# Altium project EVLSERVO1_control_v2.PrjPcb (part 4 of 9)
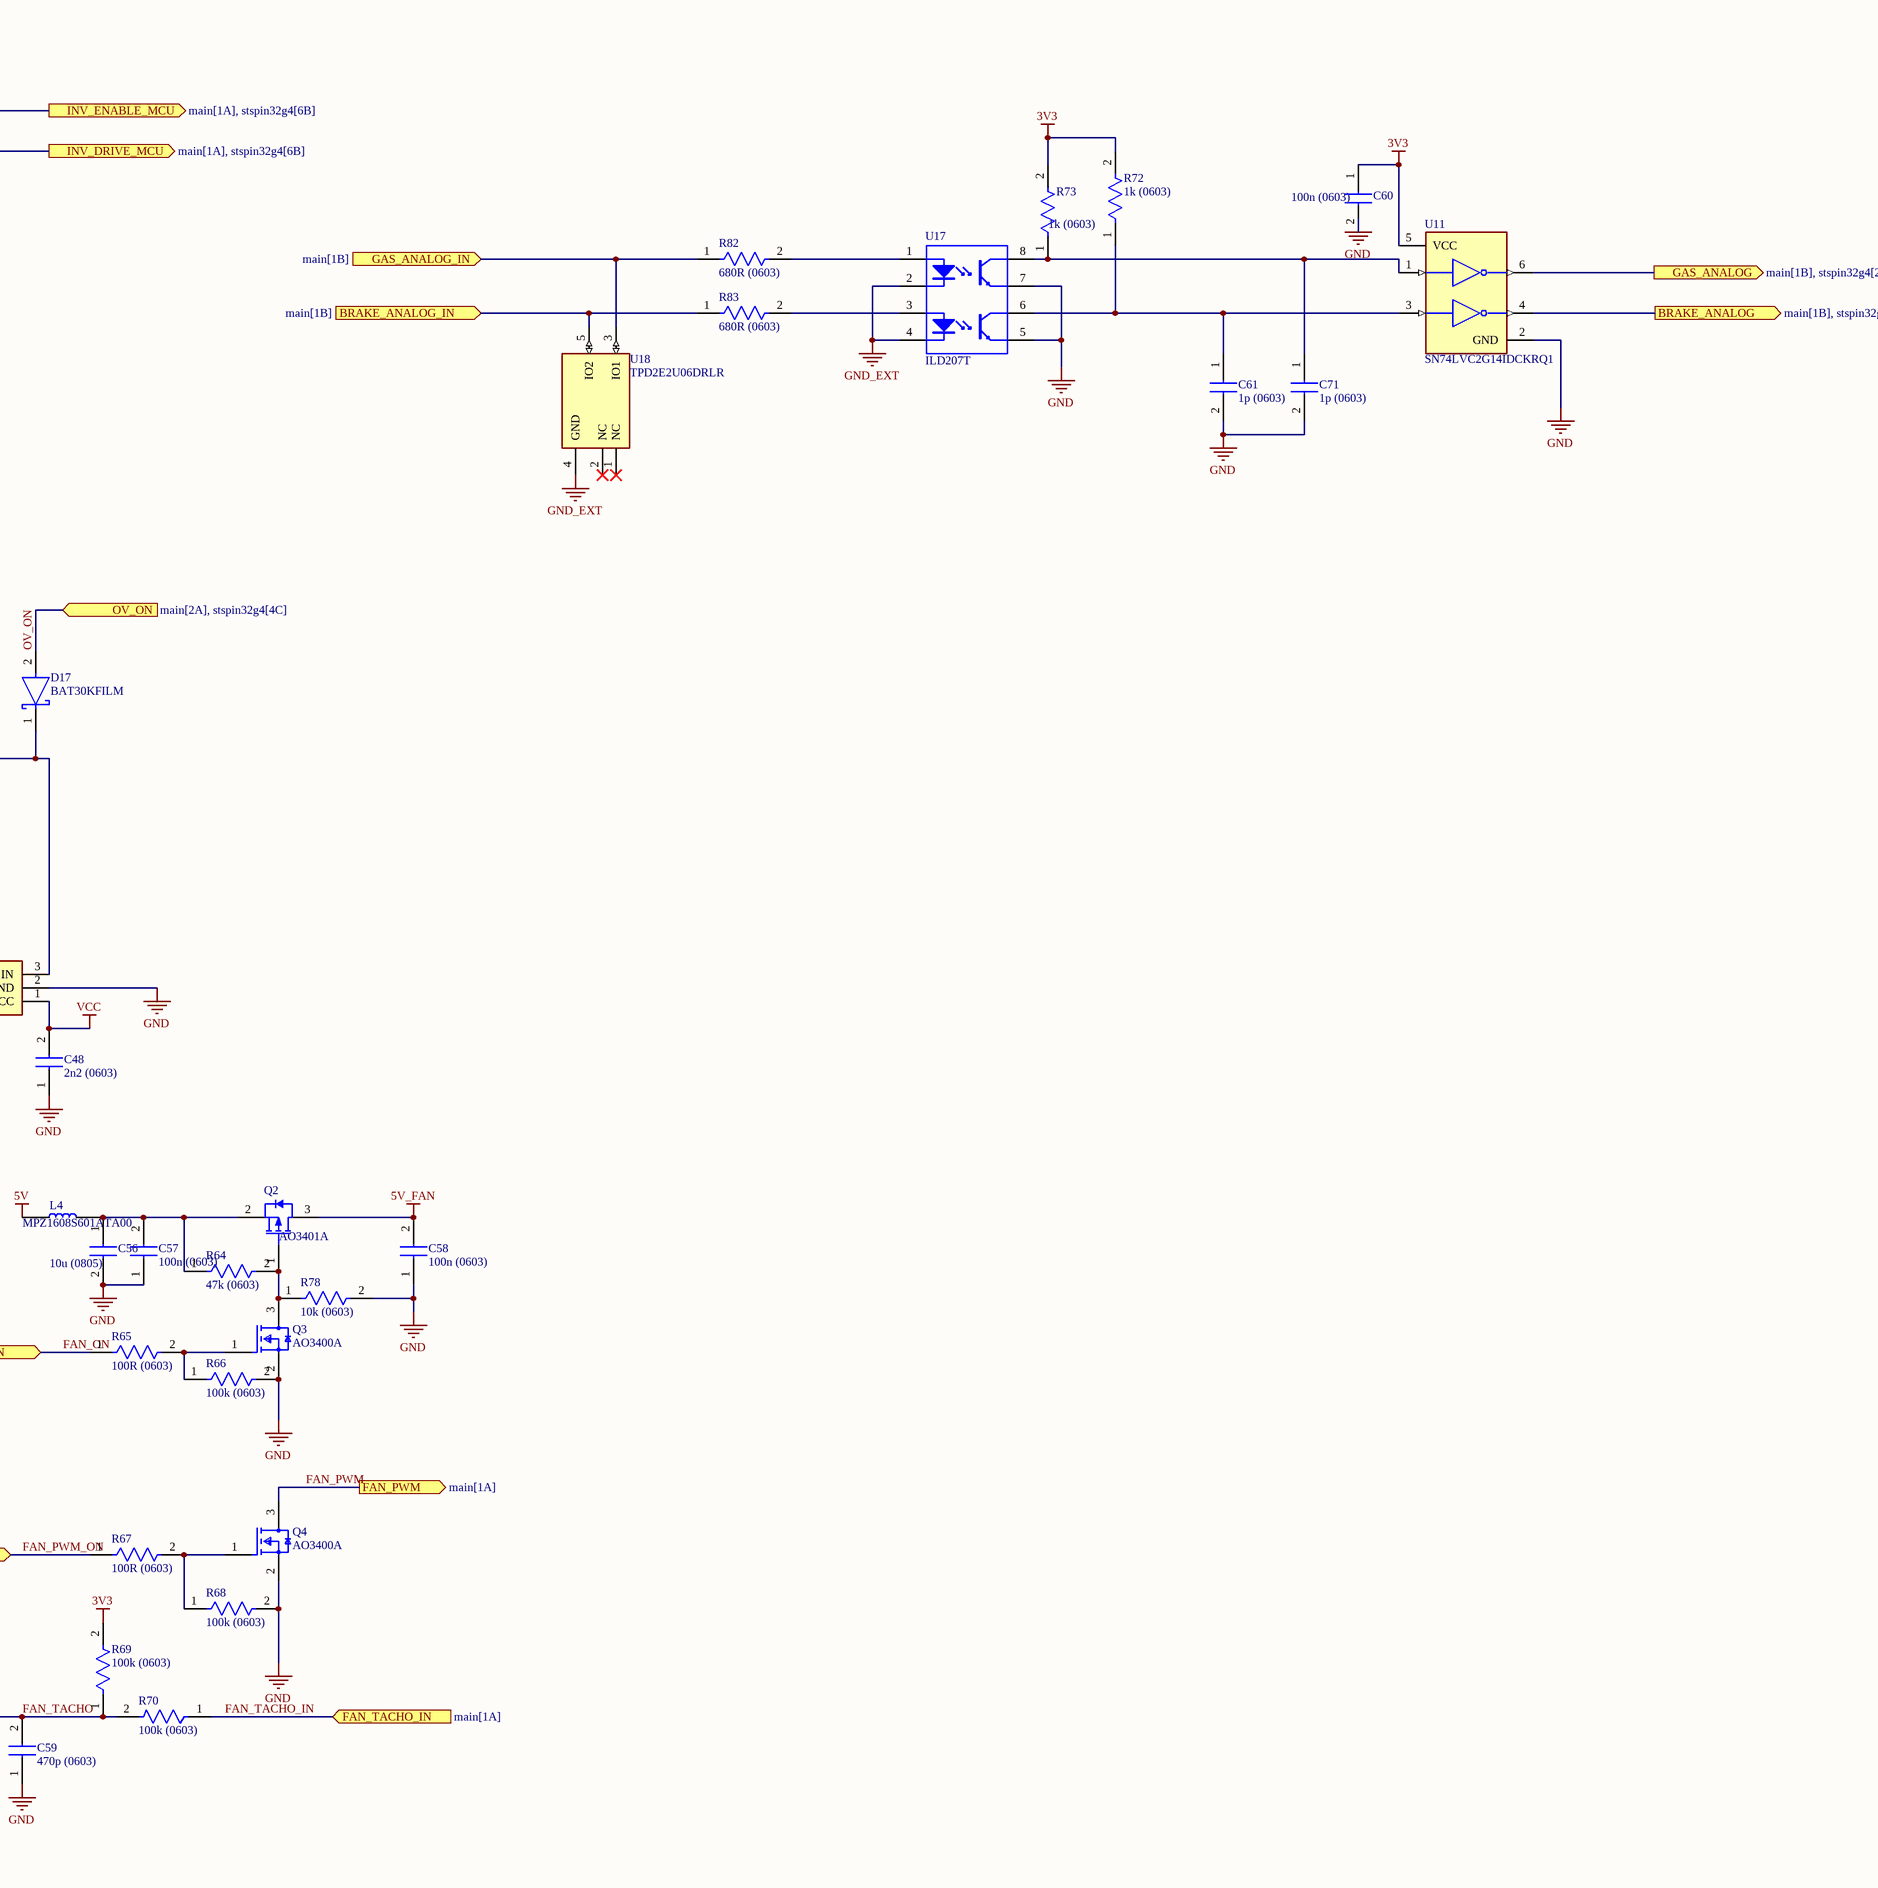
[diagram p7: peripherals.SchDoc, right]

## Sheet peripherals.SchDoc (continued)

### Library data of the parts (continued)
R47-R49 = RK73H1JTTD1000F: Res Thick Film 0603 100 Ohm 1% 0.125W(1/8W) ±100ppm/C Pad SMD Automotive T/R; Manufacturer_Name: Yageo Group; Manufacturer_Part_Number: SR0603FR-7T10KL; Manufacturer Lifecycle Status: ACTIVE; Part Series: High Temperature Chip Resistors; Power Rating: 250mW; Value: 10kΩ; Temperature Coefficient: 100ppm/°C; Voltage Rating: 75V; Working Voltage: 150V; Max Voltage Rating (DC): 100V; Voltage Rating (DC): 50V; Datasheet Link: https://mouser.componentsearchengine.com/Datasheets/1/SR0603FR-7T10KL.pdf; Height: 0.55mm; Mouser Part Number: 603-SR0603FR-7T10KL; Mouser Price/Stock: https://www.mouser.co.uk/ProductDetail/YAGEO/SR0603FR-7T10KL?qs=pfd5qewlna6IurLw3u3uRA%3D%3D; Arrow Part Number: SR0603FR-7T10KL; Arrow Price/Stock: https://www.arrow.com/en/products/sr0603fr-7t10kl/yageo; Supplier: DigiKey; Supplier Part Number: YAG5823CT-ND; Manufacturer: Yageo Group; Manufacturer Part Number: SR0603FR-7T10KL; RoHS: Compliant; Category: Chip SMD Resistors; Pricing: 1=0,67, 10=0,399, 25=0,3376, 50=0,3022, 100=0,2744, 250=0,24612, 500=0,22976, 1000=0,21675 (USD); Case/Package: 0603; China RoHS: Non-Compliant; Composition: Thick Film; Country of Origin: Mainland China, Taiwan; Export Control Classification Number (ECCN) Code: EAR99; Harmonized Tariff Schedule (HTS) Code: 8533.21.00.30; Introduction Date: 2017-10-02; Length: 1.6mm; Lifecycle Status: Production; Max Operating Temperature: 155°C; Min Operating Temperature: -55°C; Mounting Technology: Surface Mount; Number of Terminals: 2; Packaging: Tape & Reel; Ratings: AEC-Q200; REACH SVHC: Yes; Tolerance: 1%; Width: 800µm; ComponentLink1URL: https://datasheet.octopart.com:443/SR0603FR-7T10KL-Yageo-datasheet-176402240.pdf?src-supplier=Farnell; ComponentLink1Description: https://datasheet.octopart.com:443/SR0603FR-7T10KL-Yageo-datasheet-176402240.pdf?src-supplier=Farnell; ComponentLink2URL: https://datasheet.octopart.com:443/SR0603FR-7T10KL-Yageo-datasheet-119732217.pdf?src-supplier=Upverter; ComponentLink2Description: https://datasheet.octopart.com:443/SR0603FR-7T10KL-Yageo-datasheet-119732217.pdf?src-supplier=Upverter; ComponentLink3URL: https://datasheet.octopart.com:443/SR0603FR-7T10KL-Yageo-Group-datasheet-184785656.pdf?src-supplier=Future+Electronics; ComponentLink3Description: https://datasheet.octopart.com:443/SR0603FR-7T10KL-Yageo-Group-datasheet-184785656.pdf?src-supplier=Future+Electronics; ComponentLink4URL: https://datasheet.octopart.com:443/SR0603FR-7T10KL-Yageo-datasheet-155675517.pdf?src-supplier=Future+Electronics; ComponentLink4Description: https://datasheet.octopart.com:443/SR0603FR-7T10KL-Yageo-datasheet-155675517.pdf?src-supplier=Future+Electronics; ComponentLink5URL: https://datasheet.octopart.com:443/SR0603FR-7T10KL-Yageo-datasheet-137701088.pdf?src-supplier=Future+Electronics; ComponentLink5Description: https://datasheet.octopart.com:443/SR0603FR-7T10KL-Yageo-datasheet-137701088.pdf?src-supplier=Future+Electronics; ComponentLink6URL: https://datasheet.octopart.com/SR0603FR-7T10KL-Yageo-datasheet-11047080.pdf; ComponentLink6Description: https://datasheet.octopart.com/SR0603FR-7T10KL-Yageo-datasheet-11047080.pdf; ComponentLink7URL: http://sigma.octopart.com:80/conflict_mineral_statement/Yageo-company-3.pdf?src-supplier=Compliance+Statements; ComponentLink7Description: http://sigma.octopart.com:80/conflict_mineral_statement/Yageo-company-3.pdf?src-supplier=Compliance+Statements; ComponentLink8URL: http://sigma.octopart.com:80/rohs_statement/Yageo-company-2.pdf?src-supplier=Compliance+Statements; ComponentLink8Description: http://sigma.octopart.com:80/rohs_statement/Yageo-company-2.pdf?src-supplier=Compliance+Statements; Stock: 5000; ComponentLink9URL: https://datasheet.octopart.com:443/SR0603FR-7T4R7L-Yageo-datasheet-176402240.pdf?src-supplier=Farnell; ComponentLink9Description: https://datasheet.octopart.com:443/SR0603FR-7T4R7L-Yageo-datasheet-176402240.pdf?src-supplier=Farnell; ComponentLink10URL: https://datasheet.octopart.com:443/SR0603FR-7T4R7L-Yageo-datasheet-119732217.pdf?src-supplier=Upverter; ComponentLink10Description: https://datasheet.octopart.com:443/SR0603FR-7T4R7L-Yageo-datasheet-119732217.pdf?src-supplier=Upverter; ComponentLink11URL: https://datasheet.octopart.com:443/SR0603FR-7T4R7L-Yageo-Group-datasheet-184785656.pdf?src-supplier=Future+Electronics; ComponentLink11Description: https://datasheet.octopart.com:443/SR0603FR-7T4R7L-Yageo-Group-datasheet-184785656.pdf?src-supplier=Future+Electronics; ComponentLink12URL: https://datasheet.octopart.com:443/SR0603FR-7T4R7L-Yageo-datasheet-155675517.pdf?src-supplier=Future+Electronics; ComponentLink12Description: https://datasheet.octopart.com:443/SR0603FR-7T4R7L-Yageo-datasheet-155675517.pdf?src-supplier=Future+Electronics; ComponentLink13URL: https://datasheet.octopart.com:443/SR0603FR-7T4R7L-Yageo-datasheet-137701088.pdf?src-supplier=Future+Electronics; ComponentLink13Description: https://datasheet.octopart.com:443/SR0603FR-7T4R7L-Yageo-datasheet-137701088.pdf?src-supplier=Future+Electronics; ComponentLink14URL: https://datasheet.octopart.com/SR0603FR-7T4R7L-Yageo-datasheet-11047080.pdf; ComponentLink14Description: https://datasheet.octopart.com/SR0603FR-7T4R7L-Yageo-datasheet-11047080.pdf; Schedule B: 8533210045, 8533210045|8533210045|8533210045|8533210045|8533210045; ComponentLink15URL: https://datasheet.octopart.com:443/SR0603FR-7T100KL-Yageo-datasheet-176402240.pdf?src-supplier=element14+APAC; ComponentLink15Description: https://datasheet.octopart.com:443/SR0603FR-7T100KL-Yageo-datasheet-176402240.pdf?src-supplier=element14+APAC; ComponentLink16URL: https://datasheet.octopart.com:443/SR0603FR-7T100KL-Yageo-datasheet-119732217.pdf?src-supplier=Upverter; ComponentLink16Description: https://datasheet.octopart.com:443/SR0603FR-7T100KL-Yageo-datasheet-119732217.pdf?src-supplier=Upverter; ComponentLink17URL: https://datasheet.octopart.com:443/SR0603FR-7T100KL-Yageo-Group-datasheet-184785656.pdf?src-supplier=Future+Electronics; ComponentLink17Description: https://datasheet.octopart.com:443/SR0603FR-7T100KL-Yageo-Group-datasheet-184785656.pdf?src-supplier=Future+Electronics; ComponentLink18URL: https://datasheet.octopart.com:443/SR0603FR-7T100KL-Yageo-datasheet-155675517.pdf?src-supplier=Future+Electronics; ComponentLink18Description: https://datasheet.octopart.com:443/SR0603FR-7T100KL-Yageo-datasheet-155675517.pdf?src-supplier=Future+Electronics; ComponentLink19URL: https://datasheet.octopart.com:443/SR0603FR-7T100KL-Yageo-datasheet-137701088.pdf?src-supplier=Future+Electronics; ComponentLink19Description: https://datasheet.octopart.com:443/SR0603FR-7T100KL-Yageo-datasheet-137701088.pdf?src-supplier=Future+Electronics; ComponentLink20URL: https://datasheet.octopart.com/SR0603FR-7T100KL-Yageo-datasheet-11047080.pdf; ComponentLink20Description: https://datasheet.octopart.com/SR0603FR-7T100KL-Yageo-datasheet-11047080.pdf; ComponentLink21URL: https://datasheet.octopart.com:443/RS73F1JTTD2001B-KOA-Speer-datasheet-182143723.pdf?src-supplier=IHS; ComponentLink21Description: https://datasheet.octopart.com:443/RS73F1JTTD2001B-KOA-Speer-datasheet-182143723.pdf?src-supplier=IHS; ComponentLink22URL: https://datasheet.octopart.com:443/RS73F1JTTD2001B-KOA-Speer-datasheet-141350738.pdf?src-supplier=KOA+Speer+SCT; ComponentLink22Description: https://datasheet.octopart.com:443/RS73F1JTTD2001B-KOA-Speer-datasheet-141350738.pdf?src-supplier=KOA+Speer+SCT; ComponentLink23URL: https://sigma.octopart.com:443/141350679/technical_drawing/KOA-Speer-RS73F1JTTD2001B.pdf?src-supplier=KOA+Speer+SCT; ComponentLink23Description: https://sigma.octopart.com:443/141350679/technical_drawing/KOA-Speer-RS73F1JTTD2001B.pdf?src-supplier=KOA+Speer+SCT; ComponentLink24URL: http://sigma.octopart.com:80/rohs_statement/KOA-Speer-company-17.pdf?src-supplier=Compliance+Statements; ComponentLink24Description: http://sigma.octopart.com:80/rohs_statement/KOA-Speer-company-17.pdf?src-supplier=Compliance+Statements; ComponentLink25URL: https://datasheet.octopart.com:443/ERJH3EF2201V-Panasonic-datasheet-182147299.pdf?src-supplier=IHS; ComponentLink25Description: https://datasheet.octopart.com:443/ERJH3EF2201V-Panasonic-datasheet-182147299.pdf?src-supplier=IHS; ComponentLink26URL: https://datasheet.octopart.com:443/ERJH3EF2201V-Panasonic-datasheet-150823776.pdf?src-supplier=Panasonic; ComponentLink26Description: https://datasheet.octopart.com:443/ERJH3EF2201V-Panasonic-datasheet-150823776.pdf?src-supplier=Panasonic; ComponentLink27URL: https://datasheet.octopart.com:443/ERJH3EF2201V-Panasonic-datasheet-165581513.pdf?src-supplier=TME; ComponentLink27Description: https://datasheet.octopart.com:443/ERJH3EF2201V-Panasonic-datasheet-165581513.pdf?src-supplier=TME; Case Code (Imperial): 0603; Case Code (Metric): 1608; Depth: 800µm; Lead Free: Lead Free; Military Standard: Not; Pins: 2; Termination: SMD/SMT; ComponentLink28URL: https://datasheet.octopart.com:443/RK73H1JTTD1000F-KOA-Speer-datasheet-181956035.pdf?src-supplier=IHS; ComponentLink28Description: https://datasheet.octopart.com:443/RK73H1JTTD1000F-KOA-Speer-datasheet-181956035.pdf?src-supplier=IHS; ComponentLink29URL: https://datasheet.octopart.com/RK73H1JTTD1000F-KOA-Speer-datasheet-11590619.pdf; ComponentLink29Description: https://datasheet.octopart.com/RK73H1JTTD1000F-KOA-Speer-datasheet-11590619.pdf; ComponentLink30URL: https://sigma.octopart.com:443/138820520/technical_drawing/KOA-Speer-RK73H1JTTD1000F.pdf?src-supplier=Upverter; ComponentLink30Description: https://sigma.octopart.com:443/138820520/technical_drawing/KOA-Speer-RK73H1JTTD1000F.pdf?src-supplier=Upverter; ComponentLink31URL: https://datasheet.octopart.com:443/RK73H1JTTD1000F-KOA-Speer-datasheet-141253609.pdf?src-supplier=Upverter; ComponentLink31Description: https://datasheet.octopart.com:443/RK73H1JTTD1000F-KOA-Speer-datasheet-141253609.pdf?src-supplier=Upverter; ComponentLink32URL: https://datasheet.octopart.com:443/RK73H1JTTD1000F-KOA-Speer-datasheet-141913736.pdf?src-supplier=Upverter; ComponentLink32Description: https://datasheet.octopart.com:443/RK73H1JTTD1000F-KOA-Speer-datasheet-141913736.pdf?src-supplier=Upverter; ComponentLink33URL: https://datasheet.octopart.com:443/RK73H1JTTD1000F-KOA-Speer-datasheet-149653815.pdf?src-supplier=Farnell; ComponentLink33Description: https://datasheet.octopart.com:443/RK73H1JTTD1000F-KOA-Speer-datasheet-149653815.pdf?src-supplier=Farnell; ComponentLink34URL: https://datasheet.octopart.com:443/RK73H1JTTD1000F-KOA-Speer-datasheet-188906116.pdf?src-supplier=TME; ComponentLink34Description: https://datasheet.octopart.com:443/RK73H1JTTD1000F-KOA-Speer-datasheet-188906116.pdf?src-supplier=TME; ComponentLink35URL: https://datasheet.octopart.com:443/RK73H1JTTD1000F-KOA-Speer-datasheet-155997623.pdf?src-supplier=Future+Electronics; ComponentLink35Description: https://datasheet.octopart.com:443/RK73H1JTTD1000F-KOA-Speer-datasheet-155997623.pdf?src-supplier=Future+Electronics; ComponentLink36URL: https://datasheet.octopart.com:443/RK73H1JTTD1000F-KOA-Speer-datasheet-11541643.pdf?src-supplier=Arrow+Electronics; ComponentLink36Description: https://datasheet.octopart.com:443/RK73H1JTTD1000F-KOA-Speer-datasheet-11541643.pdf?src-supplier=Arrow+Electronics; ComponentLink37URL: https://datasheet.octopart.com:443/RK73H1JTTD1000F-KOA-Speer-datasheet-10854116.pdf?src-supplier=element14+APAC; ComponentLink37Description: https://datasheet.octopart.com:443/RK73H1JTTD1000F-KOA-Speer-datasheet-10854116.pdf?src-supplier=element14+APAC; ComponentLink38URL: https://datasheet.octopart.com:443/RK73H1JTTD1000F-KOA-Speer-datasheet-5377369.pdf?src-supplier=Garrett; ComponentLink38Description: https://datasheet.octopart.com:443/RK73H1JTTD1000F-KOA-Speer-datasheet-5377369.pdf?src-supplier=Garrett; ComponentLink39URL: https://datasheet.octopart.com:443/RK73H1JTTD1000F-KOA-Speer-datasheet-5377256.pdf?src-supplier=Garrett; ComponentLink39Description: https://datasheet.octopart.com:443/RK73H1JTTD1000F-KOA-Speer-datasheet-5377256.pdf?src-supplier=Garrett; ComponentLink40URL: https://datasheet.octopart.com:443/RK73H1JTTD1000F-KOA-Speer-datasheet-109233.pdf?src-supplier=Garrett; ComponentLink40Description: https://datasheet.octopart.com:443/RK73H1JTTD1000F-KOA-Speer-datasheet-109233.pdf?src-supplier=Garrett
R72-R75 = ERJ-H3EF1802V: Fixed Resistor, Metal Glaze/thick Film, 0.125W, 18000ohm, 75V, 1% +/-Tol, 100ppm/Cel, Surface Mount, 0603; Manufacturer_Name: Yageo Group; Manufacturer_Part_Number: SR0603FR-7T10KL; Manufacturer Lifecycle Status: ACTIVE; Part Series: High Temperature Chip Resistors; Power Rating: 250mW; Value: 10kΩ; Temperature Coefficient: 100ppm/°C; Working Voltage: 150V; Voltage Rating (DC): 50V; Max Power Dissipation: 125mW; Datasheet Link: https://mouser.componentsearchengine.com/Datasheets/1/SR0603FR-7T10KL.pdf; Height: 0.55mm; Mouser Part Number: 603-SR0603FR-7T10KL; Mouser Price/Stock: https://www.mouser.co.uk/ProductDetail/YAGEO/SR0603FR-7T10KL?qs=pfd5qewlna6IurLw3u3uRA%3D%3D; Arrow Part Number: SR0603FR-7T10KL; Arrow Price/Stock: https://www.arrow.com/en/products/sr0603fr-7t10kl/yageo; Supplier: DigiKey; Supplier Part Number: YAG5823CT-ND; Manufacturer: Yageo Group; Manufacturer Part Number: SR0603FR-7T10KL; RoHS: Compliant; Category: Chip SMD Resistors; Pricing: 1=0,67, 10=0,399, 25=0,3376, 50=0,3022, 100=0,2744, 250=0,24612, 500=0,22976, 1000=0,21675 (USD); Case/Package: 0603; China RoHS: Non-Compliant; Composition: Thick Film; Country of Origin: Mainland China, Taiwan; Export Control Classification Number (ECCN) Code: EAR99; Harmonized Tariff Schedule (HTS) Code: 8533.21.00.30; Introduction Date: 2017-10-02; Length: 1.6mm; Lifecycle Status: Production; Max Operating Temperature: 155°C; Min Operating Temperature: -55°C; Mounting Technology: Surface Mount; Number of Terminals: 2; Packaging: Tape & Reel; Ratings: AEC-Q200; REACH SVHC: Yes; Tolerance: 1%; Voltage Rating: 75V; Width: 800µm; ComponentLink1URL: https://datasheet.octopart.com:443/SR0603FR-7T10KL-Yageo-datasheet-176402240.pdf?src-supplier=Farnell; ComponentLink1Description: https://datasheet.octopart.com:443/SR0603FR-7T10KL-Yageo-datasheet-176402240.pdf?src-supplier=Farnell; ComponentLink2URL: https://datasheet.octopart.com:443/SR0603FR-7T10KL-Yageo-datasheet-119732217.pdf?src-supplier=Upverter; ComponentLink2Description: https://datasheet.octopart.com:443/SR0603FR-7T10KL-Yageo-datasheet-119732217.pdf?src-supplier=Upverter; ComponentLink3URL: https://datasheet.octopart.com:443/SR0603FR-7T10KL-Yageo-Group-datasheet-184785656.pdf?src-supplier=Future+Electronics; ComponentLink3Description: https://datasheet.octopart.com:443/SR0603FR-7T10KL-Yageo-Group-datasheet-184785656.pdf?src-supplier=Future+Electronics; ComponentLink4URL: https://datasheet.octopart.com:443/SR0603FR-7T10KL-Yageo-datasheet-155675517.pdf?src-supplier=Future+Electronics; ComponentLink4Description: https://datasheet.octopart.com:443/SR0603FR-7T10KL-Yageo-datasheet-155675517.pdf?src-supplier=Future+Electronics; ComponentLink5URL: https://datasheet.octopart.com:443/SR0603FR-7T10KL-Yageo-datasheet-137701088.pdf?src-supplier=Future+Electronics; ComponentLink5Description: https://datasheet.octopart.com:443/SR0603FR-7T10KL-Yageo-datasheet-137701088.pdf?src-supplier=Future+Electronics; ComponentLink6URL: https://datasheet.octopart.com/SR0603FR-7T10KL-Yageo-datasheet-11047080.pdf; ComponentLink6Description: https://datasheet.octopart.com/SR0603FR-7T10KL-Yageo-datasheet-11047080.pdf; ComponentLink7URL: http://sigma.octopart.com:80/conflict_mineral_statement/Yageo-company-3.pdf?src-supplier=Compliance+Statements; ComponentLink7Description: http://sigma.octopart.com:80/conflict_mineral_statement/Yageo-company-3.pdf?src-supplier=Compliance+Statements; ComponentLink8URL: http://sigma.octopart.com:80/rohs_statement/Yageo-company-2.pdf?src-supplier=Compliance+Statements; ComponentLink8Description: http://sigma.octopart.com:80/rohs_statement/Yageo-company-2.pdf?src-supplier=Compliance+Statements; Stock: 5000; ComponentLink9URL: https://datasheet.octopart.com:443/SR0603FR-7T4R7L-Yageo-datasheet-176402240.pdf?src-supplier=Farnell; ComponentLink9Description: https://datasheet.octopart.com:443/SR0603FR-7T4R7L-Yageo-datasheet-176402240.pdf?src-supplier=Farnell; ComponentLink10URL: https://datasheet.octopart.com:443/SR0603FR-7T4R7L-Yageo-datasheet-119732217.pdf?src-supplier=Upverter; ComponentLink10Description: https://datasheet.octopart.com:443/SR0603FR-7T4R7L-Yageo-datasheet-119732217.pdf?src-supplier=Upverter; ComponentLink11URL: https://datasheet.octopart.com:443/SR0603FR-7T4R7L-Yageo-Group-datasheet-184785656.pdf?src-supplier=Future+Electronics; ComponentLink11Description: https://datasheet.octopart.com:443/SR0603FR-7T4R7L-Yageo-Group-datasheet-184785656.pdf?src-supplier=Future+Electronics; ComponentLink12URL: https://datasheet.octopart.com:443/SR0603FR-7T4R7L-Yageo-datasheet-155675517.pdf?src-supplier=Future+Electronics; ComponentLink12Description: https://datasheet.octopart.com:443/SR0603FR-7T4R7L-Yageo-datasheet-155675517.pdf?src-supplier=Future+Electronics; ComponentLink13URL: https://datasheet.octopart.com:443/SR0603FR-7T4R7L-Yageo-datasheet-137701088.pdf?src-supplier=Future+Electronics; ComponentLink13Description: https://datasheet.octopart.com:443/SR0603FR-7T4R7L-Yageo-datasheet-137701088.pdf?src-supplier=Future+Electronics; ComponentLink14URL: https://datasheet.octopart.com/SR0603FR-7T4R7L-Yageo-datasheet-11047080.pdf; ComponentLink14Description: https://datasheet.octopart.com/SR0603FR-7T4R7L-Yageo-datasheet-11047080.pdf; Max Voltage Rating (DC): 150V; ComponentLink15URL: https://datasheet.octopart.com:443/SG73G1JTTD5102C-KOA-Speer-datasheet-181956059.pdf?src-supplier=IHS; ComponentLink15Description: https://datasheet.octopart.com:443/SG73G1JTTD5102C-KOA-Speer-datasheet-181956059.pdf?src-supplier=IHS; ComponentLink16URL: https://sigma.octopart.com:443/141350679/technical_drawing/KOA-Speer-SG73G1JTTD5102C.pdf?src-supplier=KOA+Speer+SCT; ComponentLink16Description: https://sigma.octopart.com:443/141350679/technical_drawing/KOA-Speer-SG73G1JTTD5102C.pdf?src-supplier=KOA+Speer+SCT; ComponentLink17URL: https://datasheet.octopart.com:443/SG73G1JTTD5102C-KOA-Speer-datasheet-141350755.pdf?src-supplier=KOA+Speer+SCT; ComponentLink17Description: https://datasheet.octopart.com:443/SG73G1JTTD5102C-KOA-Speer-datasheet-141350755.pdf?src-supplier=KOA+Speer+SCT; ComponentLink18URL: http://sigma.octopart.com:80/rohs_statement/KOA-Speer-company-17.pdf?src-supplier=Compliance+Statements; ComponentLink18Description: http://sigma.octopart.com:80/rohs_statement/KOA-Speer-company-17.pdf?src-supplier=Compliance+Statements; ComponentLink19URL: https://datasheet.octopart.com:443/ESR03EZPD5102-ROHM-datasheet-182147624.pdf?src-supplier=IHS; ComponentLink19Description: https://datasheet.octopart.com:443/ESR03EZPD5102-ROHM-datasheet-182147624.pdf?src-supplier=IHS; Case Code (Imperial): 0603; Case Code (Metric): 1608; Depth: 800µm; Lead Free: Lead Free; Military Standard: Not; Schedule B: 8533210045, 8533210045|8533210045, 8533210045|8533210045|8533210045, 8533210045|8533210045|8533210045|8533210045; Termination: SMD/SMT; ComponentLink20URL: https://datasheet.octopart.com:443/RK73H1JTTD68R0F-KOA-Speer-datasheet-181956035.pdf?src-supplier=IHS; ComponentLink20Description: https://datasheet.octopart.com:443/RK73H1JTTD68R0F-KOA-Speer-datasheet-181956035.pdf?src-supplier=IHS; ComponentLink21URL: https://datasheet.octopart.com:443/RK73H1JTTD68R0F-KOA-Speer-datasheet-11590619.pdf?src-supplier=Upverter; ComponentLink21Description: https://datasheet.octopart.com:443/RK73H1JTTD68R0F-KOA-Speer-datasheet-11590619.pdf?src-supplier=Upverter; ComponentLink22URL: https://datasheet.octopart.com:443/RK73H1JTTD68R0F-KOA-Speer-datasheet-149653815.pdf?src-supplier=Newark; ComponentLink22Description: https://datasheet.octopart.com:443/RK73H1JTTD68R0F-KOA-Speer-datasheet-149653815.pdf?src-supplier=Newark; ComponentLink23URL: https://datasheet.octopart.com:443/RK73H1JTTD68R0F-KOA-Speer-datasheet-10854116.pdf?src-supplier=element14+APAC; ComponentLink23Description: https://datasheet.octopart.com:443/RK73H1JTTD68R0F-KOA-Speer-datasheet-10854116.pdf?src-supplier=element14+APAC; Contact Plating: Tin; Features: Anti-Sulfur, Moisture Resistant; Number of Terminations: 2; Radiation Hardening: No; ComponentLink24URL: https://datasheet.octopart.com:443/RNCP0603FTD10K0-Stackpole-Electronics-datasheet-182148179.pdf?src-supplier=IHS; ComponentLink24Description: https://datasheet.octopart.com:443/RNCP0603FTD10K0-Stackpole-Electronics-datasheet-182148179.pdf?src-supplier=IHS; ComponentLink25URL: https://datasheet.octopart.com:443/RNCP0603FTD10K0-Stackpole-Electronics-datasheet-141193801.pdf?src-supplier=Upverter; ComponentLink25Description: https://datasheet.octopart.com:443/RNCP0603FTD10K0-Stackpole-Electronics-datasheet-141193801.pdf?src-supplier=Upverter; ComponentLink26URL: https://datasheet.octopart.com:443/RNCP0603FTD10K0-Stackpole-Electronics-datasheet-38896780.pdf?src-supplier=Upverter; ComponentLink26Description: https://datasheet.octopart.com:443/RNCP0603FTD10K0-Stackpole-Electronics-datasheet-38896780.pdf?src-supplier=Upverter; ComponentLink27URL: https://datasheet.octopart.com:443/RNCP0603FTD10K0-Stackpole-Electronics-datasheet-149178200.pdf?src-supplier=Upverter; ComponentLink27Description: https://datasheet.octopart.com:443/RNCP0603FTD10K0-Stackpole-Electronics-datasheet-149178200.pdf?src-supplier=Upverter; ComponentLink28URL: https://datasheet.octopart.com:443/RNCP0603FTD10K0-Stackpole-Electronics-datasheet-33021030.pdf?src-supplier=Future+Electronics; ComponentLink28Description: https://datasheet.octopart.com:443/RNCP0603FTD10K0-Stackpole-Electronics-datasheet-33021030.pdf?src-supplier=Future+Electronics; ComponentLink29URL: http://sigma.octopart.com:80/15942470/materials_sheet/Stackpole-Electronics-RNCP0603FTD10K0.pdf?src-supplier=Compliance+Statements; ComponentLink29Description: http://sigma.octopart.com:80/15942470/materials_sheet/Stackpole-Electronics-RNCP0603FTD10K0.pdf?src-supplier=Compliance+Statements; ComponentLink30URL: http://sigma.octopart.com:80/141158212/rohs_statement/Stackpole-Electronics-RNCP0603FTD10K0.pdf?src-supplier=Compliance+Statements; ComponentLink30Description: http://sigma.octopart.com:80/141158212/rohs_statement/Stackpole-Electronics-RNCP0603FTD10K0.pdf?src-supplier=Compliance+Statements; ComponentLink31URL: http://sigma.octopart.com:80/141158211/reach_statement/Stackpole-Electronics-RNCP0603FTD10K0.pdf?src-supplier=Compliance+Statements; ComponentLink31Description: http://sigma.octopart.com:80/141158211/reach_statement/Stackpole-Electronics-RNCP0603FTD10K0.pdf?src-supplier=Compliance+Statements; ComponentLink32URL: https://datasheet.octopart.com:443/ERJH3EF1802V-Panasonic-datasheet-182147299.pdf?src-supplier=IHS; ComponentLink32Description: https://datasheet.octopart.com:443/ERJH3EF1802V-Panasonic-datasheet-182147299.pdf?src-supplier=IHS; ComponentLink33URL: https://datasheet.octopart.com:443/ERJH3EF1802V-Panasonic-datasheet-150823776.pdf?src-supplier=Panasonic; ComponentLink33Description: https://datasheet.octopart.com:443/ERJH3EF1802V-Panasonic-datasheet-150823776.pdf?src-supplier=Panasonic; ComponentLink34URL: https://datasheet.octopart.com:443/ERJH3EF1802V-Panasonic-datasheet-165581513.pdf?src-supplier=TME; ComponentLink34Description: https://datasheet.octopart.com:443/ERJH3EF1802V-Panasonic-datasheet-165581513.pdf?src-supplier=TME
R76 R77 R82 R83 = RK73H1JTTD1001F: Resistor Thick Film 0603 1K Ohm 1% 1/10W ±100ppm/°C SMD Punched Paper Tape and Reel; Manufacturer_Name: Yageo Group; Manufacturer_Part_Number: SR0603FR-7T10KL; Power Rating: 250mW; Value: 10kΩ; Voltage Rating: 75V; Working Voltage: 150V; Voltage Rating (DC): 50V; Datasheet Link: https://mouser.componentsearchengine.com/Datasheets/1/SR0603FR-7T10KL.pdf; Height: 0.55mm; Mouser Part Number: 603-SR0603FR-7T10KL; Mouser Price/Stock: https://www.mouser.co.uk/ProductDetail/YAGEO/SR0603FR-7T10KL?qs=pfd5qewlna6IurLw3u3uRA%3D%3D; Arrow Part Number: SR0603FR-7T10KL; Arrow Price/Stock: https://www.arrow.com/en/products/sr0603fr-7t10kl/yageo; Supplier: DigiKey; Supplier Part Number: YAG5823CT-ND; Manufacturer: Yageo Group; Manufacturer Part Number: SR0603FR-7T10KL; RoHS: Compliant; Category: Chip SMD Resistors; Pricing: 1=0,67, 10=0,399, 25=0,3376, 50=0,3022, 100=0,2744, 250=0,24612, 500=0,22976, 1000=0,21675 (USD); Case/Package: 0603; China RoHS: Non-Compliant; Composition: Thick Film; Country of Origin: Mainland China, Taiwan; Export Control Classification Number (ECCN) Code: EAR99; Harmonized Tariff Schedule (HTS) Code: 8533.21.00.30; Introduction Date: 2017-10-02; Length: 1.6mm; Lifecycle Status: Production; Max Operating Temperature: 155°C; Min Operating Temperature: -55°C; Mounting Technology: Surface Mount; Number of Terminals: 2; Packaging: Tape & Reel; Ratings: AEC-Q200; REACH SVHC: Yes; Temperature Coefficient: 100ppm/°C; Tolerance: 1%; Width: 800µm; ComponentLink1URL: https://datasheet.octopart.com:443/SR0603FR-7T10KL-Yageo-datasheet-176402240.pdf?src-supplier=Farnell; ComponentLink1Description: https://datasheet.octopart.com:443/SR0603FR-7T10KL-Yageo-datasheet-176402240.pdf?src-supplier=Farnell; ComponentLink2URL: https://datasheet.octopart.com:443/SR0603FR-7T10KL-Yageo-datasheet-119732217.pdf?src-supplier=Upverter; ComponentLink2Description: https://datasheet.octopart.com:443/SR0603FR-7T10KL-Yageo-datasheet-119732217.pdf?src-supplier=Upverter; ComponentLink3URL: https://datasheet.octopart.com:443/SR0603FR-7T10KL-Yageo-Group-datasheet-184785656.pdf?src-supplier=Future+Electronics; ComponentLink3Description: https://datasheet.octopart.com:443/SR0603FR-7T10KL-Yageo-Group-datasheet-184785656.pdf?src-supplier=Future+Electronics; ComponentLink4URL: https://datasheet.octopart.com:443/SR0603FR-7T10KL-Yageo-datasheet-155675517.pdf?src-supplier=Future+Electronics; ComponentLink4Description: https://datasheet.octopart.com:443/SR0603FR-7T10KL-Yageo-datasheet-155675517.pdf?src-supplier=Future+Electronics; ComponentLink5URL: https://datasheet.octopart.com:443/SR0603FR-7T10KL-Yageo-datasheet-137701088.pdf?src-supplier=Future+Electronics; ComponentLink5Description: https://datasheet.octopart.com:443/SR0603FR-7T10KL-Yageo-datasheet-137701088.pdf?src-supplier=Future+Electronics; ComponentLink6URL: https://datasheet.octopart.com/SR0603FR-7T10KL-Yageo-datasheet-11047080.pdf; ComponentLink6Description: https://datasheet.octopart.com/SR0603FR-7T10KL-Yageo-datasheet-11047080.pdf; ComponentLink7URL: http://sigma.octopart.com:80/conflict_mineral_statement/Yageo-company-3.pdf?src-supplier=Compliance+Statements; ComponentLink7Description: http://sigma.octopart.com:80/conflict_mineral_statement/Yageo-company-3.pdf?src-supplier=Compliance+Statements; ComponentLink8URL: http://sigma.octopart.com:80/rohs_statement/Yageo-company-2.pdf?src-supplier=Compliance+Statements; ComponentLink8Description: http://sigma.octopart.com:80/rohs_statement/Yageo-company-2.pdf?src-supplier=Compliance+Statements; Stock: 5000; ComponentLink9URL: https://datasheet.octopart.com:443/SR0603FR-7T4R7L-Yageo-datasheet-176402240.pdf?src-supplier=Farnell; ComponentLink9Description: https://datasheet.octopart.com:443/SR0603FR-7T4R7L-Yageo-datasheet-176402240.pdf?src-supplier=Farnell; ComponentLink10URL: https://datasheet.octopart.com:443/SR0603FR-7T4R7L-Yageo-datasheet-119732217.pdf?src-supplier=Upverter; ComponentLink10Description: https://datasheet.octopart.com:443/SR0603FR-7T4R7L-Yageo-datasheet-119732217.pdf?src-supplier=Upverter; ComponentLink11URL: https://datasheet.octopart.com:443/SR0603FR-7T4R7L-Yageo-Group-datasheet-184785656.pdf?src-supplier=Future+Electronics; ComponentLink11Description: https://datasheet.octopart.com:443/SR0603FR-7T4R7L-Yageo-Group-datasheet-184785656.pdf?src-supplier=Future+Electronics; ComponentLink12URL: https://datasheet.octopart.com:443/SR0603FR-7T4R7L-Yageo-datasheet-155675517.pdf?src-supplier=Future+Electronics; ComponentLink12Description: https://datasheet.octopart.com:443/SR0603FR-7T4R7L-Yageo-datasheet-155675517.pdf?src-supplier=Future+Electronics; ComponentLink13URL: https://datasheet.octopart.com:443/SR0603FR-7T4R7L-Yageo-datasheet-137701088.pdf?src-supplier=Future+Electronics; ComponentLink13Description: https://datasheet.octopart.com:443/SR0603FR-7T4R7L-Yageo-datasheet-137701088.pdf?src-supplier=Future+Electronics; ComponentLink14URL: https://datasheet.octopart.com/SR0603FR-7T4R7L-Yageo-datasheet-11047080.pdf; ComponentLink14Description: https://datasheet.octopart.com/SR0603FR-7T4R7L-Yageo-datasheet-11047080.pdf; Schedule B: 8533210045, 8533210045|8533210045|8533210045|8533210045|8533210045; ComponentLink15URL: https://datasheet.octopart.com:443/SR0603FR-7T100KL-Yageo-datasheet-176402240.pdf?src-supplier=element14+APAC; ComponentLink15Description: https://datasheet.octopart.com:443/SR0603FR-7T100KL-Yageo-datasheet-176402240.pdf?src-supplier=element14+APAC; ComponentLink16URL: https://datasheet.octopart.com:443/SR0603FR-7T100KL-Yageo-datasheet-119732217.pdf?src-supplier=Upverter; ComponentLink16Description: https://datasheet.octopart.com:443/SR0603FR-7T100KL-Yageo-datasheet-119732217.pdf?src-supplier=Upverter; ComponentLink17URL: https://datasheet.octopart.com:443/SR0603FR-7T100KL-Yageo-Group-datasheet-184785656.pdf?src-supplier=Future+Electronics; ComponentLink17Description: https://datasheet.octopart.com:443/SR0603FR-7T100KL-Yageo-Group-datasheet-184785656.pdf?src-supplier=Future+Electronics; ComponentLink18URL: https://datasheet.octopart.com:443/SR0603FR-7T100KL-Yageo-datasheet-155675517.pdf?src-supplier=Future+Electronics; ComponentLink18Description: https://datasheet.octopart.com:443/SR0603FR-7T100KL-Yageo-datasheet-155675517.pdf?src-supplier=Future+Electronics; ComponentLink19URL: https://datasheet.octopart.com:443/SR0603FR-7T100KL-Yageo-datasheet-137701088.pdf?src-supplier=Future+Electronics; ComponentLink19Description: https://datasheet.octopart.com:443/SR0603FR-7T100KL-Yageo-datasheet-137701088.pdf?src-supplier=Future+Electronics; ComponentLink20URL: https://datasheet.octopart.com/SR0603FR-7T100KL-Yageo-datasheet-11047080.pdf; ComponentLink20Description: https://datasheet.octopart.com/SR0603FR-7T100KL-Yageo-datasheet-11047080.pdf; Case Code (Imperial): 0603; Case Code (Metric): 1608; Depth: 800µm; Lead Free: Lead Free; Military Standard: Not; Pins: 2; Termination: SMD/SMT; ComponentLink21URL: https://datasheet.octopart.com:443/RK73H1JTTD1001F-KOA-Speer-datasheet-181956035.pdf?src-supplier=IHS; ComponentLink21Description: https://datasheet.octopart.com:443/RK73H1JTTD1001F-KOA-Speer-datasheet-181956035.pdf?src-supplier=IHS; ComponentLink22URL: https://datasheet.octopart.com/RK73H1JTTD1001F-KOA-Speer-datasheet-11590619.pdf; ComponentLink22Description: https://datasheet.octopart.com/RK73H1JTTD1001F-KOA-Speer-datasheet-11590619.pdf; ComponentLink23URL: https://datasheet.octopart.com:443/RK73H1JTTD1001F-KOA-Speer-datasheet-149653815.pdf?src-supplier=element14+APAC; ComponentLink23Description: https://datasheet.octopart.com:443/RK73H1JTTD1001F-KOA-Speer-datasheet-149653815.pdf?src-supplier=element14+APAC; ComponentLink24URL: https://datasheet.octopart.com:443/RK73H1JTTD1001F-KOA-Speer-datasheet-10854116.pdf?src-supplier=element14+APAC; ComponentLink24Description: https://datasheet.octopart.com:443/RK73H1JTTD1001F-KOA-Speer-datasheet-10854116.pdf?src-supplier=element14+APAC; ComponentLink25URL: https://datasheet.octopart.com:443/RK73H1JTTD1001F-KOA-Speer-datasheet-188906116.pdf?src-supplier=TME; ComponentLink25Description: https://datasheet.octopart.com:443/RK73H1JTTD1001F-KOA-Speer-datasheet-188906116.pdf?src-supplier=TME; ComponentLink26URL: https://datasheet.octopart.com:443/RK73H1JTTD1001F-KOA-Speer-datasheet-155997623.pdf?src-supplier=Future+Electronics; ComponentLink26Description: https://datasheet.octopart.com:443/RK73H1JTTD1001F-KOA-Speer-datasheet-155997623.pdf?src-supplier=Future+Electronics; ComponentLink27URL: https://datasheet.octopart.com:443/RK73H1JTTD1001F-KOA-Speer-datasheet-11541643.pdf?src-supplier=Arrow+Electronics; ComponentLink27Description: https://datasheet.octopart.com:443/RK73H1JTTD1001F-KOA-Speer-datasheet-11541643.pdf?src-supplier=Arrow+Electronics; ComponentLink28URL: https://datasheet.octopart.com:443/RK73H1JTTD1001F-KOA-Speer-datasheet-5377369.pdf?src-supplier=Garrett; ComponentLink28Description: https://datasheet.octopart.com:443/RK73H1JTTD1001F-KOA-Speer-datasheet-5377369.pdf?src-supplier=Garrett; ComponentLink29URL: https://datasheet.octopart.com:443/RK73H1JTTD1001F-KOA-Speer-datasheet-5377256.pdf?src-supplier=Garrett; ComponentLink29Description: https://datasheet.octopart.com:443/RK73H1JTTD1001F-KOA-Speer-datasheet-5377256.pdf?src-supplier=Garrett; ComponentLink30URL: https://datasheet.octopart.com:443/RK73H1JTTD1001F-KOA-Speer-datasheet-109233.pdf?src-supplier=Garrett; ComponentLink30Description: https://datasheet.octopart.com:443/RK73H1JTTD1001F-KOA-Speer-datasheet-109233.pdf?src-supplier=Garrett; ComponentLink31URL: https://datasheet.octopart.com:443/RK73H1JTTD1001F-KOA-Speer-datasheet-5313488.pdf?src-supplier=Verical; ComponentLink31Description: https://datasheet.octopart.com:443/RK73H1JTTD1001F-KOA-Speer-datasheet-5313488.pdf?src-supplier=Verical; ComponentLink32URL: http://sigma.octopart.com:80/rohs_statement/KOA-Speer-company-17.pdf?src-supplier=Compliance+Statements; ComponentLink32Description: http://sigma.octopart.com:80/rohs_statement/KOA-Speer-company-17.pdf?src-supplier=Compliance+Statements
TP3 = TestPoint45: Standard test point 50mil
TP4 = TestPoint: Standard test point 1mm
U2 = PM8851D: Integrated Circuit; Manufacturer_Name: STMicroelectronics; Datasheet Link: https://www.st.com/resource/en/datasheet/pm8851.pdf; Height: 1.45mm; Manufacturer_Part_Number: PM8851D; Mouser Part Number: 511-PM8851D; Mouser Price/Stock: https://www.mouser.co.uk/ProductDetail/STMicroelectronics/PM8851D?qs=WHlX%252B%252B9%2FRwBtUBZTIUM2qQ%3D%3D; Arrow Part Number: PM8851D; Arrow Price/Stock: https://www.arrow.com/en/products/pm8851d/stmicroelectronics?utm_currency=USD&region=europe
U3-U5 U7 = INA241A3IDDFR: Integrated Circuit; Manufacturer_Name: Texas Instruments; Datasheet Link: https://www.ti.com/lit/ds/symlink/ina241a.pdf?ts=1700994119914&ref_url=https%253A%252F%252Fwww.ti.com%252Fproduct%252FINA241A%253FkeyMatch%253DINA241A3IDDFR%2526tisearch%253Dsearch-everything%2526usecase%253DOPN-ALT; Height: 1.1mm; Manufacturer_Part_Number: INA241A3IDDFR; Mouser Part Number: 595-INA241A3IDDFR; Mouser Price/Stock: https://www.mouser.co.uk/ProductDetail/Texas-Instruments/INA241A3IDDFR?qs=IPgv5n7u5QbnUHvSWsi3EA%3D%3D; Arrow Part Number: INA241A3IDDFR; Arrow Price/Stock: https://www.arrow.com/en/products/ina241a3iddfr/texas-instruments?utm_currency=USD&region=nac
U6 = CMP-04872-000236-1: IC TXRX/ISO FULL 1/1 8SOIC; Receiver Hysteresis: 125mV; Simplex/Duplex: Full Duplex; Data Rate: 5Mbps; Max Operating Temperature: 125°C; Mount: Surface Mount; Series: Automotive, AEC-Q100; RoHS Compliant: Yes; Case/Package: SOIC; Min Operating Temperature: -40°C
U8 = TS3011IYQ3T: Integrated Circuit; Manufacturer_Name: STMicroelectronics; Datasheet Link: https://www.st.com/resource/en/datasheet/ts3011.pdf; Height: 0.8mm; Manufacturer_Part_Number: TS3011IYQ3T; Mouser Part Number: 511-TS3011IYQ3T; Mouser Price/Stock: https://www.mouser.co.uk/ProductDetail/STMicroelectronics/TS3011IYQ3T?qs=qSfuJ%252Bfl%2Fd44zMkM7Ep99A%3D%3D; Arrow Part Number: TS3011IYQ3T; Arrow Price/Stock: https://www.arrow.com/en/products/ts3011iyq3t/stmicroelectronics?utm_currency=USD&region=nac
U11 U14 = CMP-0859-00447-5: IC INVERT SCHMITT 2CH 2IN SC70-6; Propagation Delay: 9.5ns; Number of Inputs: 1; Min Supply Voltage: 1.65V; Turn-On Delay Time: 4.3ns; Max Supply Voltage: 5.5V; Schmitt Trigger Input: Yes; Quiescent Current: 10uA; Number of Elements: 2; Max Output Current: 32mA; Input Type: SCHMITT TRIGGER; High Level Output Current: -32mA; Logic Function: Buffer; Width: 1.25mm; Lead Free: Lead Free; Package Quantity: 3000; Min Operating Temperature: -40°C; Termination: SMD/SMT; Mount: Surface Mount; Radiation Hardening: No; Number of Pins: 6; Height: 0.9mm; Output Current: 32mA; REACH SVHC: No SVHC; RoHS Compliant: Yes; Contact Plating: Gold; Max Operating Temperature: 85°C; Length: 2mm; Number of Bits: 2; Number of Circuits: 2; Technology: CMOS; Number of Gates: 2; Low Level Output Current: 32mA; Case/Package: SC; Packaging: Tape and Reel; Series: 74LVC
U13 U18 = CMP-04985-000005-1: TVS DIODE 5.5V 12.4V SOT5; Manufacturer: Texas Instruments; Standoff Height: 0mm; Interface: USB,Ethernet,LVDS,Other; Peak Pulse Current: 5.5A; Number Of Channels: 2; Clamping Voltage: 9.7V; Peak Pulse Power: 85W; Breakdown Voltage: 6.5V; Direction: Unidirectional; Digikey Description: TVS DIODE 5.5V 12.4V SOT5; Footprint Url: http://www.ti.com/lit/ds/symlink/sn74ahct1g08.pdf; ComponentLink2URL: http://www.ti.com/lit/ds/symlink/tpd2e2u06.pdf; Ambient Temperature Range Low: -40°C; Temperature: -40°C to +125°C; Temperature Range Low: -40°C; Lead Free: Yes; Automotive: No; Octopart: https://octopart.com/tpd2e2u06drlr-texas+instruments-47095345; Ambient Temperature Range High: +125°C; Height: 0.6mm; RoHS: TRUE; Category: IC; Package: DRL0005A; Device Class L1: Circuit Protection; Temperature Range High: +125°C; Manufacturer Part Number: TPD2E2U06DRLR; Device Class L2: ESD and Circuit Protection ICs; Ipc Land Pattern Name: SOTFL50P160X55-6; ComponentLink2Description: Datasheet; Mouser Description: ESD Suppressors Dual-Ch High-Speed ESD Protection; Reverse Standoff Voltage: 5.5V; Device Class L3: unset
U15 U17 = CMP-2000-06453-1: Optocoupler, Phototransistor Output, Dual Channel, 4000 VRMS, -55 to 100 degC, 8-Pin SOIC, RoHS, Tape and Reel; Manufacturer: Vishay; Voltage - Output (Max): 70V; Vce Saturation (Max): 400mV; Number of Channels: 2; Voltage - Forward (Vf) (Typ): 1.2V; EDA / CAD Models: DownloadfromAcceleratedDesigns; Current Transfer Ratio (Min): 100%@10mA; Current Transfer Ratio (Max): 200%@10mA; Input Type: DC; Current - DC Forward (If) (Max): 30mA; Rise / Fall Time (Typ): 3µs,4.7µs; Turn On / Turn Off Time (Typ): 6µs,5µs; Catalog Drawings: OptocouplerCircuit; Other Names: 751-1310-1ILD207TGICTILD207TGICT-ND; Online Catalog: ILD205T,206T,207T,211T,213T,217TSeries; Mounting Type: SurfaceMount; Package Description: 8-Pin Small Outline Integrated Circuit, Body 5.84 x 3.91 mm, Pitch 1.27 mm; Output Type: Transistor; Package / Case: 8-SOIC(0.154",3.90mmWidth); Category: Isolators; Operating Temperature: -55°C~100°C; Family: Optoisolators-Transistor,PhotovoltaicOutput; Package Reference: SOIC-8; Voltage - Isolation: 4000Vrms; Supplier Device Package: 8-SOIC; Standard Package: 1; Manufacturer URL: http://www.vishay.com/; Series: -; Packaging: CutTape(CT); Datasheet Version: Rev. 2.1, 10/2015; Datasheet URL: http://www.vishay.com/docs/83647/ild205t.pdf; Mounting Technology: SurfaceMount; Current - Output / Channel: -

## Sheet power.SchDoc
size A3; SheetNumber: 4; SheetTotal: 4
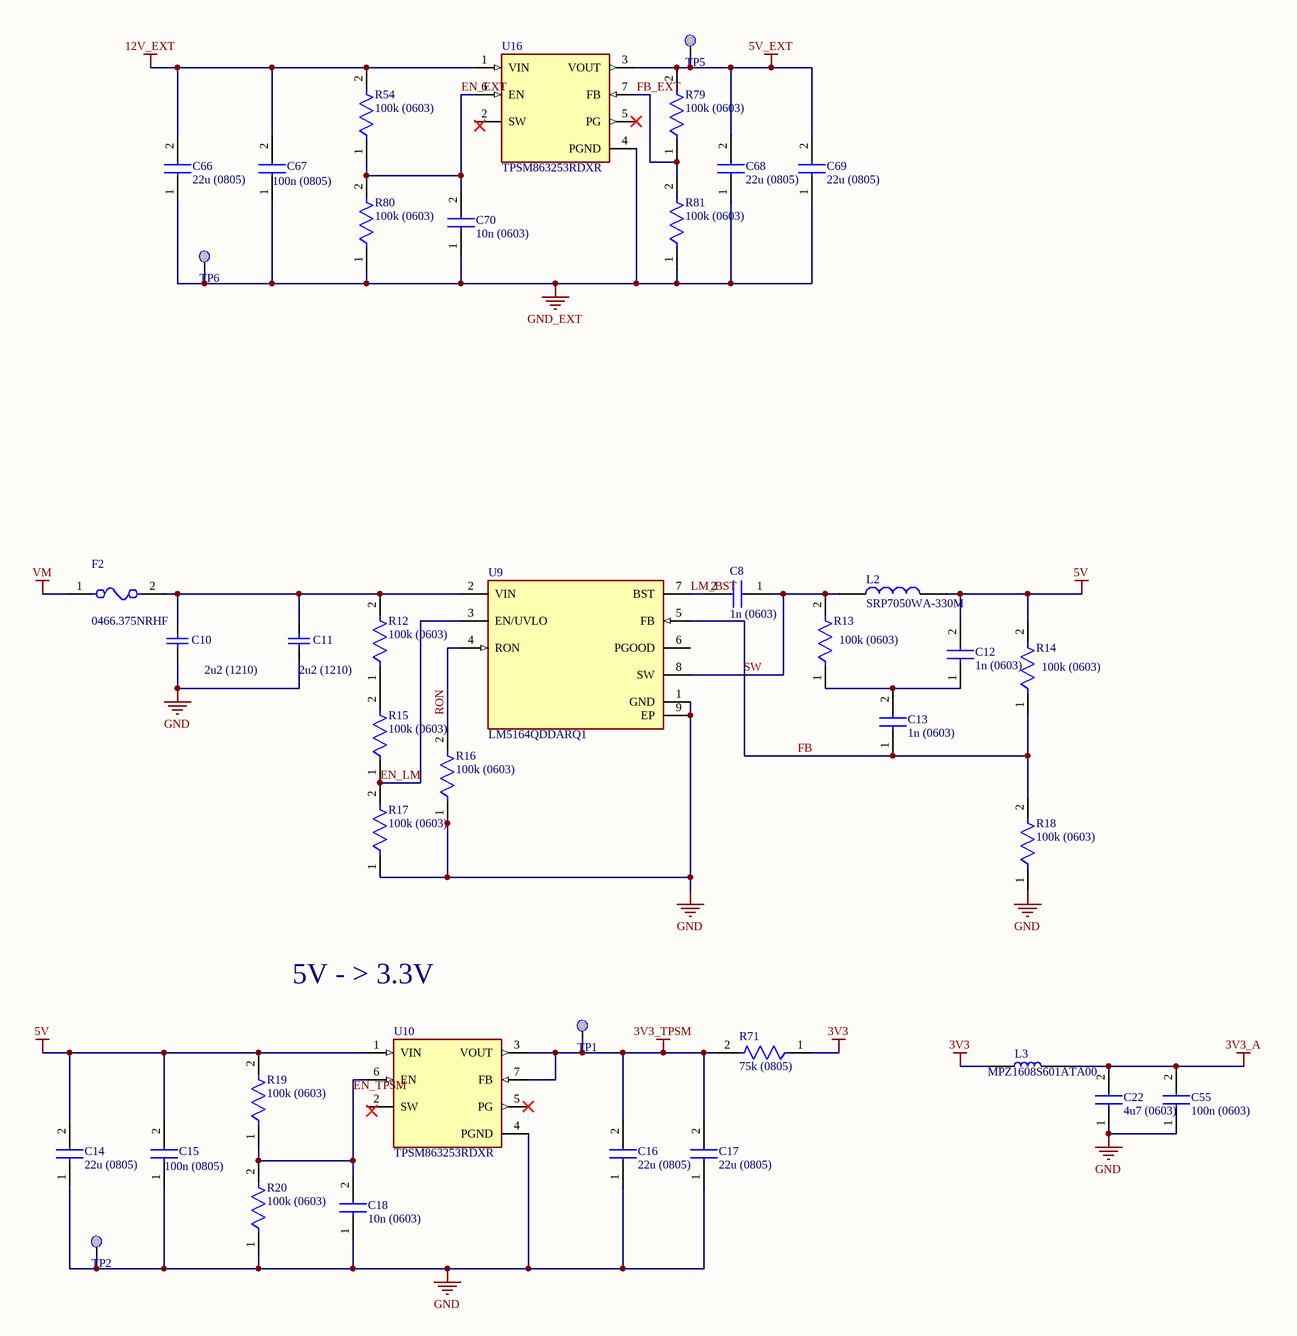
[diagram p3: power.SchDoc]

### Parts
C8  1n (0603)  [C0603]
C10  2u2 (1210)  [WCAP-CSGP_1210_L3.2W2.5H2.5]
C11  2u2 (1210)  [WCAP-CSGP_1210_L3.2W2.5H2.5]
C12  1n (0603)  [C0603]
C13  1n (0603)  [C0603]
C14  22u (0805)  [C0805]
C15  100n (0805)  [C0805]
C16  22u (0805)  [C0805]
C17  22u (0805)  [C0805]
C18  10n (0603)  [C0603]
C22  4u7 (0603)  [C0603]
C55  100n (0603)  [C0603]
C66  22u (0805)  [C0805]
C67  100n (0805)  [C0805]
C68  22u (0805)  [C0805]
C69  22u (0805)  [C0805]
C70  10n (0603)  [C0603]
F2  0466.375NRHF  [FP-0466-MFG]
L2  SRP7050WA-330M  [SRP7050WA-330M]
L3  MPZ1608S601ATA00  [INDC1608X95N]
R12  100k (0603)  [R0603]
R13  100k (0603)  [R0603]
R14  100k (0603)  [R0603]
R15  100k (0603)  [R0603]
R16  100k (0603)  [R0603]
R17  100k (0603)  [R0603]
R18  100k (0603)  [R0603]
R19  100k (0603)  [R0603]
R20  100k (0603)  [R0603]
R54  100k (0603)  [R0603]
R71  75k (0805)  [R0805]
R79  100k (0603)  [R0603]
R80  100k (0603)  [R0603]
R81  100k (0603)  [R0603]
TP1  TP  [Test_Point_50]  (value not drawn)
TP2  TP  [Test_Point_50]  (value not drawn)
TP5  TP  [Test_Point_50]  (value not drawn)
TP6  TP  [Test_Point_50]  (value not drawn)
U9  LM5164QDDARQ1  [FP-DDA0008A-IPC_B]
U10  TPSM863253RDXR  [TPSM863253RDXR]
U16  TPSM863253RDXR  [TPSM863253RDXR]

### Nets
3V3: L3.1 R71.1
3V3_A: C22.2 C55.2 L3.2
3V3_TPSM: C16.2 C17.2 R71.2 TP1.1 U10.3(VOUT) U10.7(FB)
5V: C12.2 C14.2 C15.2 L2.2 R14.2 R19.2 U10.1(VIN)
5V_EXT: C68.2 C69.2 R79.2 TP5.1 U16.3(VOUT)
12V_EXT: C66.2 C67.2 R54.2 U16.1(VIN)
GND: C10.1 C11.1 C14.1 C15.1 C16.1 C17.1 C18.1 C22.1 C55.1 R16.1 R17.1 R18.1 R20.1 TP2.1 U9.9(EP) U10.4(PGND)
GND_EXT: C66.1 C67.1 C68.1 C69.1 C70.1 R80.1 R81.1 TP6.1 U16.4(PGND)
VM: F2.1
EN_EXT: C70.2 R54.1 R80.2 U16.6(EN)
EN_LM: R15.1 R17.2 U9.3(EN/UVLO)
EN_TPSM: C18.2 R19.1 R20.2 U10.6(EN)
FB: C13.1 R14.1 R18.2 U9.5(FB)
FB_EXT: R79.1 R81.2 U16.7(FB)
LM_BST: C8.2 U9.7(BST)
RON: R16.2 U9.4(RON)
SW: C8.1 L2.1 R13.2 U9.8(SW)
NetC10_2: C10.2 C11.2 F2.2 R12.2 U9.2(VIN)
NetC12_1: C12.1 C13.2 R13.1
NetR12_1: R12.1 R15.2

Not connected (* = marked no-connect by the designer): U9 1(GND) 6(PGOOD); U10 2(SW) 5(PG)*; U16 2(SW) 5(PG)*

### Notes on the sheet
- 5V - > 3.3V